# Altium project GPS v2.PrjPcb
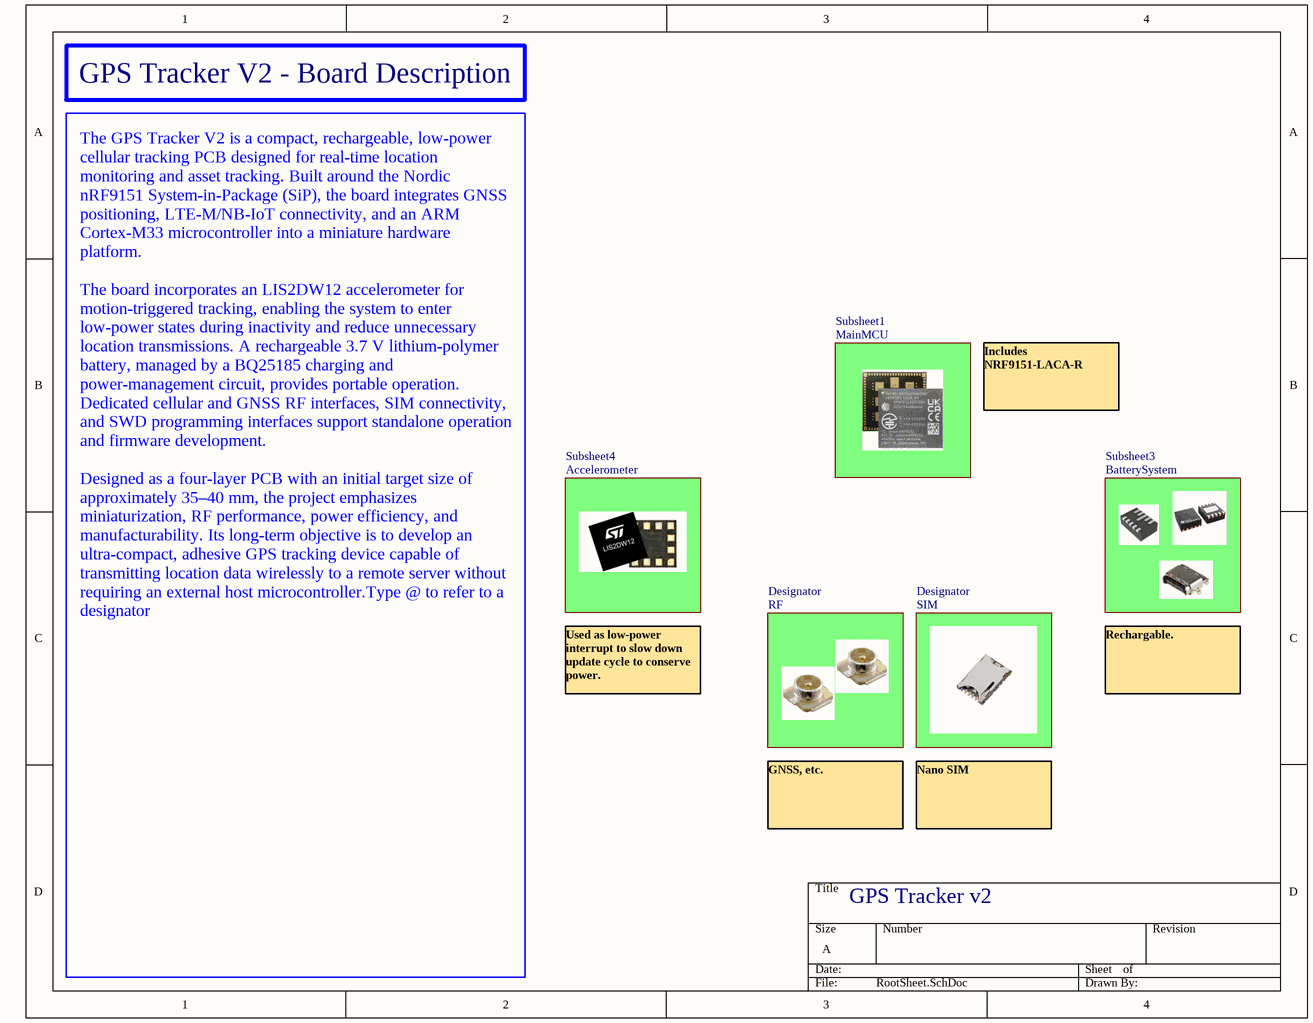
[diagram p0: RootSheet.SchDoc]
6 sheets, 10 parts. Net scope: flat (ports and power ports of the same name join across sheets).
Sheets:
  RootSheet.SchDoc
    Subsheet1 = MainMCU.SchDoc
    Subsheet4 = Accelerometer.SchDoc
    Subsheet3 = BatterySystem.SchDoc
    Designator = RF.SchDoc
    Designator = SIM.SchDoc

## Sheet RootSheet.SchDoc
size A; SheetNumber: 1; SheetTotal: 6

### Sub-sheets
Designator = RF: no entries
Designator = SIM: no entries
Subsheet1 = MainMCU: no entries
Subsheet3 = BatterySystem: no entries
Subsheet4 = Accelerometer: no entries

### Notes on the sheet
- GPS Tracker V2 - Board Description
- Includes NRF9151-LACA-R
- Used as low-power interrupt to slow down update cycle to conserve power.
- Rechargable.
- GNSS, etc.
- Nano SIM
- GPS Tracker v2
- The GPS Tracker V2 is a compact, rechargeable, low-power cellular tracking PCB designed for real-time location monitoring and asset tracking. Built around the Nordic nRF9151 System-in-Package (SiP), the board integrates GNSS positioning, LTE-M/NB-IoT connectivity, and an ARM Cortex-M33 microcontroller into a miniature hardware platform.
  The board incorporates an LIS2DW12 accelerometer for motion-triggered tracking, enabling the system to enter low-power states during inactivity and reduce unnecessary location transmissions. A rechargeable 3.7 V lithium-polymer battery, managed by a BQ25185 charging and power-management circuit, provides portable operation. Dedicated cellular and GNSS RF interfaces, SIM connectivity, and SWD programming interfaces support standalone operation and firmware development.
  Designed as a four-layer PCB with an initial target size of approximately 35–40 mm, the project emphasizes miniaturization, RF performance, power efficiency, and manufacturability. Its long-term objective is to develop an ultra-compact, adhesive GPS tracking device capable of transmitting location data wirelessly to a remote server without requiring an external host microcontroller.Type @ to refer to a designator

## Sheet MainMCU.SchDoc
size A; SheetNumber: 2; SheetTotal: 5
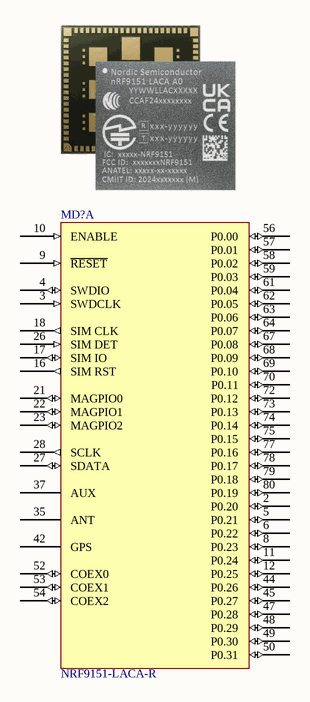
[diagram p1: MainMCU.SchDoc]

### Parts
MD?  NRF9151-LACA-R  [FP-nRF9151-LACA-R_MFG]  (part A of 2)

### Nets

Not connected (* = marked no-connect by the designer): MD? 2(P0.20) 3(SWDCLK) 4(SWDIO) 5(P0.21) 6(P0.22) 8(P0.23) 9(~{RESET}) 10(ENABLE) 11(P0.24) 12(P0.25) 16(SIM_RST) 17(SIM_IO) 18(SIM_CLK) 21(MAGPIO0) 22(MAGPIO1) 23(MAGPIO2) 26(SIM_DET) 27(SDATA) 28(SCLK) 35(ANT) 37(AUX) 42(GPS) 44(P0.26) 45(P0.27) 47(P0.28) 48(P0.29) 49(P0.30) 50(P0.31) 52(COEX0) 53(COEX1) 54(COEX2) 56(P0.00) 57(P0.01) 58(P0.02) 59(P0.03) 61(P0.04) 62(P0.05) 63(P0.06) 64(P0.07) 67(P0.08) 68(P0.09) 69(P0.10) 70(P0.11) 72(P0.12) 73(P0.13) 74(P0.14) 75(P0.15) 77(P0.16) 78(P0.17) 79(P0.18) 80(P0.19)

### Library data of the parts
MD? = CMP-03900-155507741-1: Low power SiP with integrated LTE-M/NB-IoT and DECT NR+ modem, and GNSS; ComponentLink1Description: Manufacturer URL; ComponentLink1URL: http://www.nordicsemi.com/; ComponentLink2Description: Datasheet URL; ComponentLink2URL: https://docs.nordicsemi.com/bundle/ps_nrf9151/page/mec_spec.html

## Sheet Accelerometer.SchDoc
size A; SheetNumber: 4; SheetTotal: 6
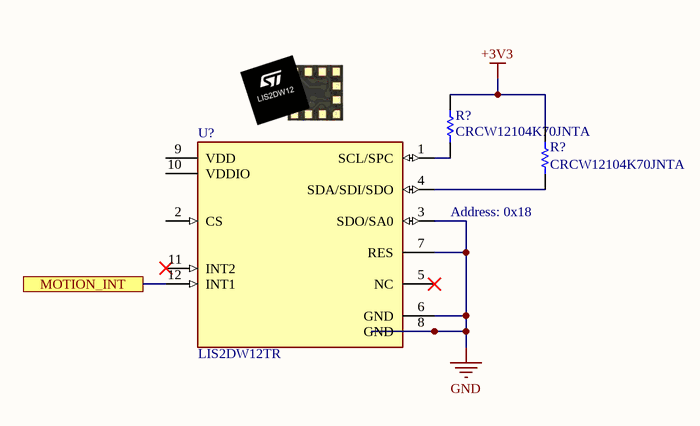
[diagram p2: Accelerometer.SchDoc]

### Parts
(Parts that share a designator on the sheet are numbered #1, #2 ... from top to bottom, then left to right.)
R?#1  CRCW12104K70JNTA  [RESC3225X60X45ML20T20]
R?#2  CRCW12104K70JNTA  [RESC3225X60X45ML20T20]
U?#1  LIS2DW12TR  [FP-LGA12-DM00170568-MFG]

### Ports
MOTION_INT

### Nets
+3V3: R?#1.2 R?#2.2
GND: U?#1.3(SDO/SA0) U?#1.6(GND) U?#1.7(RES) U?#1.8(GND)
NetR?#1_1: R?#1.1 U?#1.1(SCL/SPC)
NetR?#2_1: R?#2.1 U?#1.4(SDA/SDI/SDO)
NetU?#1_12: U?#1.12(INT1) ; port MOTION_INT

Not connected (* = marked no-connect by the designer): U?#1 2(CS) 5(NC)* 9(VDD) 10(VDDIO) 11(INT2)*

### Notes on the sheet
- Address: 0x18

### Library data of the parts
R?#1 R?#2 = CMP-2005-00822-1: 4.7k ohm; Manufacturer: Vishay Dale; Part Number: CRCW12104K70JNTA
U?#1 = CMP-12175-000006-1: ACCEL 2-16G I2C/SPI 12LGA; Manufacturer: STMicroelectronics; Min Supply Voltage: 1.62V; Operating Supply Current: 0.38-90uA; Sensor Output: I2C,SPI; Accel Resolution: 14bits; Max Supply Voltage: 3.6V; Accel Range: 2/4/8/16g; Height: 0.7mm; Device Class L1: Sensors; RoHS: TRUE; Temperature Range Low: -40°C; Category: IC; Mouser Description: Accelerometer Triple ±2g/±4g/±8g/±16g 1.62V to 3.6V 0.244mg/digit/0.488mg/digit/0.976mg/digit/1.952mg/digit 12-Pin LG...; Digikey Description: ACCEL 2-16G I2C/SPI 12LGA; ComponentLink2URL: https://www.st.com/resource/en/datasheet/lis2dw12.pdf; Automotive: No; Manufacturer Part Number: LIS2DW12TR; Lead Free: Yes; Footprint Url: https://www.st.com/content/ccc/resource/technical/document/technical_note/73/17/9c/16/dd/96/4a/01/CD00134799.pdf/files/CD00134799.pdf/jcr:content/translations/en.CD00134799.pdf; Temperature: -40°C to +85°C; Device Class L3: Accelerometers; Package: LGA12-DM00170568; Temperature Range High: +85°C; Device Class L2: Motion Sensors; Octopart: https://octopart.com/lis2dw12tr-stmicroelectronics-77080925; ComponentLink2Description: Datasheet

## Sheet BatterySystem.SchDoc
size A; SheetNumber: 3; SheetTotal: 6
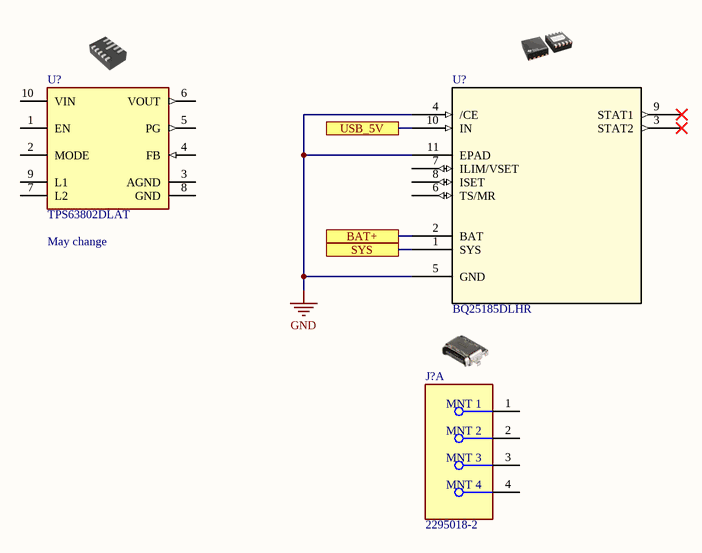
[diagram p3: BatterySystem.SchDoc]

### Parts
(Parts that share a designator on the sheet are numbered #1, #2 ... from top to bottom, then left to right.)
J?#1  2295018-2  [FP-2295018-2-MFG]  (part A of 3)
U?#2  TPS63802DLAT  [FP-DLA0010A-MFG]
U?#3  BQ25185DLHR  [WSON10_DLH_TEX]

### Ports
BAT+, SYS, USB_5V

### Nets
GND: U?#3.4(/CE) U?#3.5(GND) U?#3.11(EPAD)
NetU?#3_1: U?#3.1(SYS) ; port SYS
NetU?#3_2: U?#3.2(BAT) ; port BAT+
NetU?#3_10: U?#3.10(IN) ; port USB_5V

Not connected (* = marked no-connect by the designer): J?#1 1(MNT_1) 2(MNT_2) 3(MNT_3) 4(MNT_4); U?#2 1(EN) 2(MODE) 3(AGND) 4(FB) 5(PG) 6(VOUT) 7(L2) 8(GND) 9(L1) 10(VIN); U?#3 3(STAT2)* 6(TS/MR) 7(ILIM/VSET) 8(ISET) 9(STAT1)*

### Notes on the sheet
- (near U?#2) May change

### Library data of the parts
J?#1 = CMP-03360-000011-1: CONN RCPT USB3.1 TYPEC 24POS SMD; Plating: Bright; Contact Current Rating: 5A; Connector System: Cable-to-Board; Number of Ports: 1; Circuit Application: Signal; Number of Positions: 24; Gender: Receptacle; Pitch: 0.5mm; Lead Free: Lead Free; Packaging: Tape and Reel; Min Operating Temperature: -30°C; RoHS Compliant: Yes; Housing Color: Black; Housing Material: Thermoplastic; Orientation: Right Angle; Connector Type: Receptacle; Max Operating Temperature: 85°C; USB Standard: USB 3.1; Contact Material: Copper Alloy; Contact Plating: Gold; Termination: SMD/SMT
U?#2 = CMP-04918-000461-1: IC POWER MANAGEMENT; RoHS Compliant: Yes
U?#3 = BQ25185DLHR: 1-cell, 1-A stand-alone linear battery charger with power path and solar input support 10-WSON -40 to 125; Manufacturer_Name: Texas Instruments; Type: Power Management; Copyright: Copyright (C) 2025 Ultra Librarian. All rights reserved.; Manufacturer_Part_Number: BQ25185DLHR; RefDes: RefDes

## Sheet RF.SchDoc
size A; SheetNumber: 5; SheetTotal: 6
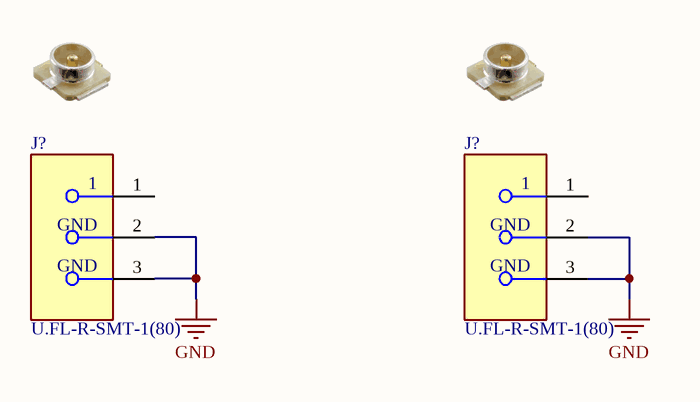
[diagram p4: RF.SchDoc]

### Parts
(Parts that share a designator on the sheet are numbered #1, #2 ... from top to bottom, then left to right.)
J?#2  U.FL-R-SMT-1(80)  [FP-U_FL-R-SMT-1_80-MFG]
J?#3  U.FL-R-SMT-1(80)  [FP-U_FL-R-SMT-1_80-MFG]

### Nets
GND: J?#2.2(GND) J?#2.3(GND) J?#3.2(GND) J?#3.3(GND)

Not connected (* = marked no-connect by the designer): J?#2 1; J?#3 1

### Library data of the parts
J?#2 J?#3 = CMP-11598-000004-1: CONN U.FL RCPT STR 50 OHM SMD; Mating Cycles: 30; Impedance: 50R; Body Plating: Silver; Center Contact Plating: Gold; Body Material: Bronze; Dielectric Material: Polymer; Connector Type: Receptacle; Number of Ports: 1; Max Frequency: 6GHz; Mount: Surface Mount; Termination: Solder; Case/Package: SMD/SMT; Min Operating Temperature: -40°C; Series: U.FL; Max Operating Temperature: 90°C; Fastening Type: SNAP-ON; RoHS Compliant: Yes; Packaging: Tape and Reel; Package Quantity: 10000; Contact Material: Brass; Housing Color: Beige; Lead Free: Lead Free

## Sheet SIM.SchDoc
size A; SheetNumber: 6; SheetTotal: 6
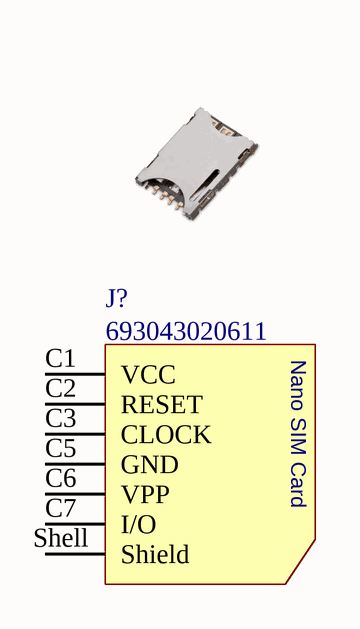
[diagram p5: SIM.SchDoc]

### Parts
(Parts that share a designator on the sheet are numbered #1, #2 ... from top to bottom, then left to right.)
J?#4  693043020611  [693043020611]

### Nets

Not connected (* = marked no-connect by the designer): J?#4 C1(VCC) C2(RESET) C3(CLOCK) C5(GND) C6(VPP) C7(I/O) Shell(Shield)

### Notes on the sheet
- (in symbol CMP-1502-00157-3) Nano SIM Card

### Library data of the parts
J?#4 = CMP-1502-00157-3: Memory Card Connectors WR-CRD Nano SIM SMT 1.2mm Push/Pull; Number of Positions: 6; Insulation Resistance: 500MΩ; Operating Supply Voltage: 15V; Current Rating: 1A; Mount: Surface Mount; Connector Type: Connector; Contact Plating: Gold; Height: 1.3mm; Number of Pins: 6; Max Operating Temperature: 85°C; Lead Free: Lead Free; Packaging: Tape and Reel; REACH SVHC: Unknown; Features: Shielded; Contact Material: Gold; RoHS: Compliant; Number of Contacts: 6; Min Operating Temperature: -25°C; Voltage Rating: 15V

## Nets that join several sheets
GND: Accelerometer (U?#1.3 U?#1.6 U?#1.7 U?#1.8), BatterySystem (U?#3.4 U?#3.5 U?#3.11), RF (J?#2.2 J?#2.3 J?#3.2 J?#3.3)